# Altium project CC2538 Development Kit Version 2.PrjPcb
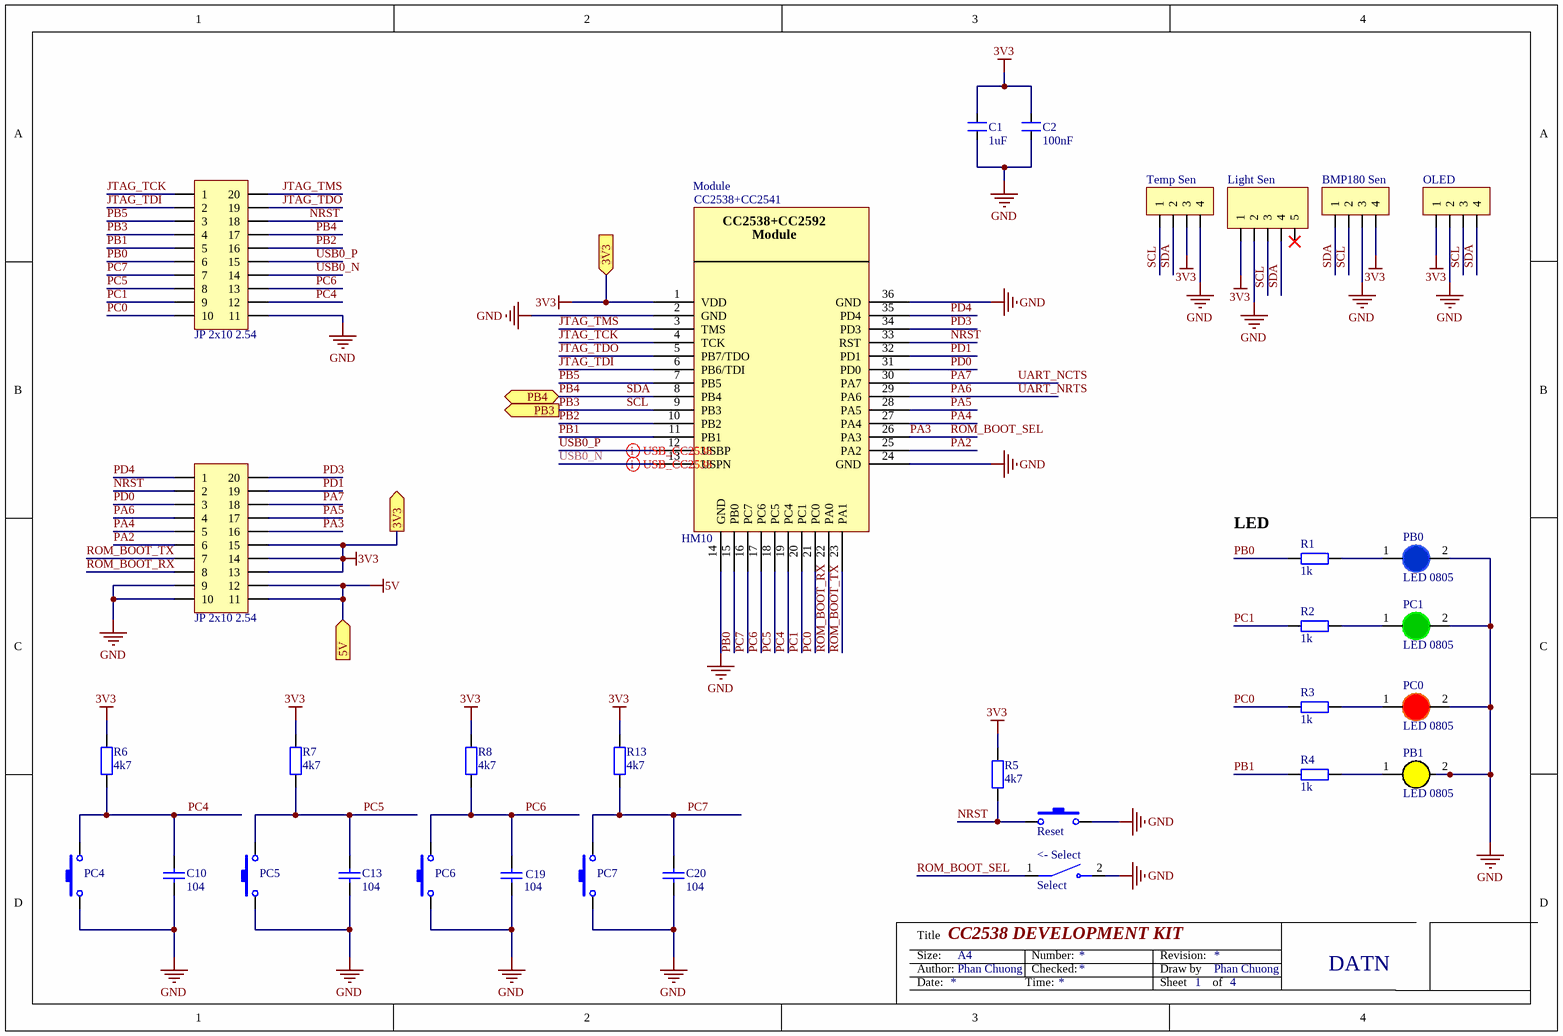
[diagram p0: MCU.SchDoc]
4 sheets, 70 parts. Net scope: global (net labels, ports and power ports of the same name join across sheets).
Board file: PCB.PcbDoc
Sheets:
  MCU.SchDoc
  Power.SchDoc
  Flashing.SchDoc
  RTC.SchDoc

## Sheet MCU.SchDoc: CC2538
size A4; SheetNumber: 1; SheetTotal: 4

### Parts
<-_Select  Select  [SW_KAE01SGGT]
BMP180_Sens  BMP180 Sen  [JP 1x4 CT]
C1  1uF  [SM-0805]
C2  100nF  [SM-0805]
C10  104  [tu 0805]
C13  104  [tu 0805]
C19  104  [tu 0805]
C20  104  [tu 0805]
JP7  JP 2x10 2.54  [JP 2x10 DT]
JP9  JP 2x10 2.54  [JP 2x10 DT]
Light_Sens  Light Sen  [JP 1x5 CT]
Module  HM10  [CC2538+CC2541]
OLED  OLED  [JP 1x4 CT]
PB0  LED 0805  [LED-0805-Blue]
PB1  LED 0805  [LED-0805-Yellow]
PC0  LED 0805  [LED-0805-Red]
PC1  LED 0805  [LED-0805-Green]
PC4  SW-SMD  [SW-SMD]  (value not drawn)
PC5  SW-SMD  [SW-SMD]  (value not drawn)
PC6  SW-SMD  [SW-SMD]  (value not drawn)
PC7  SW-SMD  [SW-SMD]  (value not drawn)
R1  1k  [RES-SMD-0805]
R2  1k  [RES-SMD-0805]
R3  1k  [RES-SMD-0805]
R4  1k  [RES-SMD-0805]
R5  4k7  [tro smd 0805]
R6  4k7  [tro smd 0805]
R7  4k7  [tro smd 0805]
R8  4k7  [tro smd 0805]
R13  4k7  [tro smd 0805]
Reset  SW-SMD  [SW-SMD]  (value not drawn)
Temp_sens  Temp Sen  [JP 1x4 CT]

### Ports
3V3 (in), 3V3 (out), 5V (in), PB3 (out), PB4 (bidir)

### Nets
3V3: BMP180_Sens.4 C1.2 C2.2 JP9.13 JP9.14 JP9.15 Light_Sens.1 Module.1(VDD) OLED.1 R5.2 R6.2 R7.2 R8.2 R13.2 Temp_sens.3 ; port 3V3
5V: JP9.11 JP9.12 ; port 5V
GND: <-_Select.2 BMP180_Sens.3 C1.1 C2.1 C10.2 C13.2 C19.2 C20.2 JP7.11 JP9.9 JP9.10 Light_Sens.2 Module.2(GND) Module.14(GND) Module.24(GND) Module.36(GND) OLED.2 PB0.2(K) PB1.2(K) PC0.2(K) PC1.2(K) PC4.1 PC5.1 PC6.1 PC7.1 Reset.2 Temp_sens.4
JTAG_TCK: JP7.1 Module.4(TCK)
JTAG_TDI: JP7.2 Module.6(PB6/TDI)
JTAG_TDO: JP7.19 Module.5(PB7/TDO)
JTAG_TMS: JP7.20 Module.3(TMS)
NRST: JP7.18 JP9.2 Module.33(RST) R5.1 Reset.1
PA2: JP9.6 Module.25(PA2)
PA3: <-_Select.1 JP9.16 Module.26(PA3)  [also labelled ROM_BOOT_SEL]
PA4: JP9.5 Module.27(PA4)
PA5: JP9.17 Module.28(PA5)
PA6: JP9.4 Module.29(PA6)  [also labelled UART_NRTS]
PA7: JP9.18 Module.30(PA7)  [also labelled UART_NCTS]
PB0: JP7.6 Module.15(PB0) R1.1
PB1: JP7.5 Module.11(PB1) R4.1
PB2: JP7.16 Module.10(PB2)
PB3: BMP180_Sens.2 JP7.4 Light_Sens.3 Module.9(PB3) OLED.3 Temp_sens.1 ; port PB3  [also labelled SCL]
PB4: BMP180_Sens.1 JP7.17 Light_Sens.4 Module.8(PB4) OLED.4 Temp_sens.2 ; port PB4  [also labelled SDA]
PB5: JP7.3 Module.7(PB5)
PC0: JP7.10 Module.21(PC0) R3.1
PC1: JP7.9 Module.20(PC1) R2.1
PC4: C10.1 JP7.12 Module.19(PC4) PC4.2 R6.1
PC5: C13.1 JP7.8 Module.18(PC5) PC5.2 R7.1
PC6: C19.1 JP7.13 Module.17(PC6) PC6.2 R8.1
PC7: C20.1 JP7.7 Module.16(PC7) PC7.2 R13.1
PD0: JP9.3 Module.31(PD0)
PD1: JP9.19 Module.32(PD1)
PD3: JP9.20 Module.34(PD3)
PD4: JP9.1 Module.35(PD4)
ROM_BOOT_RX: JP9.8 Module.22(PA0)
ROM_BOOT_TX: JP9.7 Module.23(PA1)
USB0_N: JP7.14 Module.13(USPN)
USB0_P: JP7.15 Module.12(USBP)
NetPB0_1: PB0.1(A) R1.2
NetPB1_1: PB1.1(A) R4.2
NetPC0_1: PC0.1(A) R3.2
NetPC1_1: PC1.1(A) R2.2

Not connected (* = marked no-connect by the designer): Light_Sens 5*

### Layout directives
differential pair: USB0_N, USB0_P

### Notes on the sheet
- (near R1) LED
- Title
- Size:
- Date:
- Author:
- CC2538 DEVELOPMENT KIT
- A4
- Phan Chuong
- Time:
- Number:
- Checked:
- Revision:
- Sheet
- Draw by
- of
- DATN
- (in symbol CC2538 HM10) CC2538+CC2541; CC2538+CC2592

### Library data of the parts
<-_Select = KAE01SGGT: Dip Switch SPST 1 Position Surface Mount Slide (Standard) Actuator 25mA 24VDC; MF: E-Switch; Check_prices: https://www.snapeda.com/parts/KAE01SGGT/E-Switch/view-part/?ref=eda; Value: *; Availability: In Stock; MP: KAE01SGGT; Price: None; Package: None; SnapEDA_Link: https://www.snapeda.com/parts/KAE01SGGT/E-Switch/view-part/?ref=snap; Purchase-URL: https://pricing.snapeda.com/search/part/KAE01SGGT/?ref=eda
BMP180_Sens OLED Temp_sens = JP 1x4 2.54 Cai Thang: Cắm; Ten_Linh_Kien: Jump Đơn Cái 2.54MM 1x20P Thẳng; Don_Vi: Con; Ma_Hang: MH004006; Ghi_Chu: *; Kieu_Chan: *; Chung_Loai: Cắm
C1 C2 = CM: Cap SMD; Value: 103
C10 C13 C19 C20 = Tu 0805 104 50V 10%: Dán; Don_Vi: Con; So_Chan: 2; Ten_Linh_Kien: Tụ 0805 104-100nF 10% 50V; Ma_Hang: MH004551; Chung_Loai: Dán; Kieu_Chan: *
JP7 JP9 = JP 2x10 2.54 Duc Thang: Cắm; Ten_Linh_Kien: Jump Đôi Đực 2.54MM 2x40P Thẳng 11MM; Don_Vi: Con; Ma_Hang: MH002686; Ghi_Chu: *; Kieu_Chan: *; Chung_Loai: Cắm
Light_Sens = JP 1x5 2.54 Cai Thang: Cắm; Ten_Linh_Kien: Jump Đơn Cái 2.54MM 1x20P Thẳng; Don_Vi: Con; Ma_Hang: MH004006; Ghi_Chu: *; Kieu_Chan: *; Chung_Loai: Cắm
Module = CC2538 HM10: BLE HM10
PB0 = LED 0805 Xanh Duong: Dán; Don_Vi: Con; Ma_Hang: MH002327; Ten_Linh_Kien: LED 0805 Màu Xanh Dương (Blue); Ghi_Chu: *; Kieu_Chan: *; Chung_Loai: Dán
PB1 = LED 0805 Vang: Dán; Don_Vi: Con; Ma_Hang: MH002329; Ten_Linh_Kien: LED 0805 Màu Vàng ( Yellow); Ghi_Chu: *; Kieu_Chan: *; Chung_Loai: Dán
PC0 = LED 0805 Do: Dán; Don_Vi: Con; Ma_Hang: MH000897; Ten_Linh_Kien: LED 0805 Màu Đỏ (Red); Ghi_Chu: *; Kieu_Chan: *; Chung_Loai: Dán
PC1 = LED 0805 Xanh La: Dán; Don_Vi: Con; Ma_Hang: MH002326; Ten_Linh_Kien: LED 0805 Màu Xanh Lá (Green); Ghi_Chu: *; Kieu_Chan: *; Chung_Loai: Dán
PC4-PC7 Reset = SW-SMD: Switch; Published: 24-Mar-1999; LatestRevisionDate: 17-Jul-2002; LatestRevisionNote: Re-released for DXP Platform.; PackageReference: SPST-2; Publisher: Altium Limited
R1-R4 = R: Resistor R1/4W
R5-R8 R13 = Tro 0805 1% 0.22R: Dán; Don_Vi: Con; So_Chan: 2; Ten_Linh_Kien: Trở 0805 1% 0.22R; Ma_Hang: MH005466; Chung_Loai: Dán; Kieu_Chan: *

## Sheet Power.SchDoc
size A4; SheetNumber: 3; SheetTotal: 5
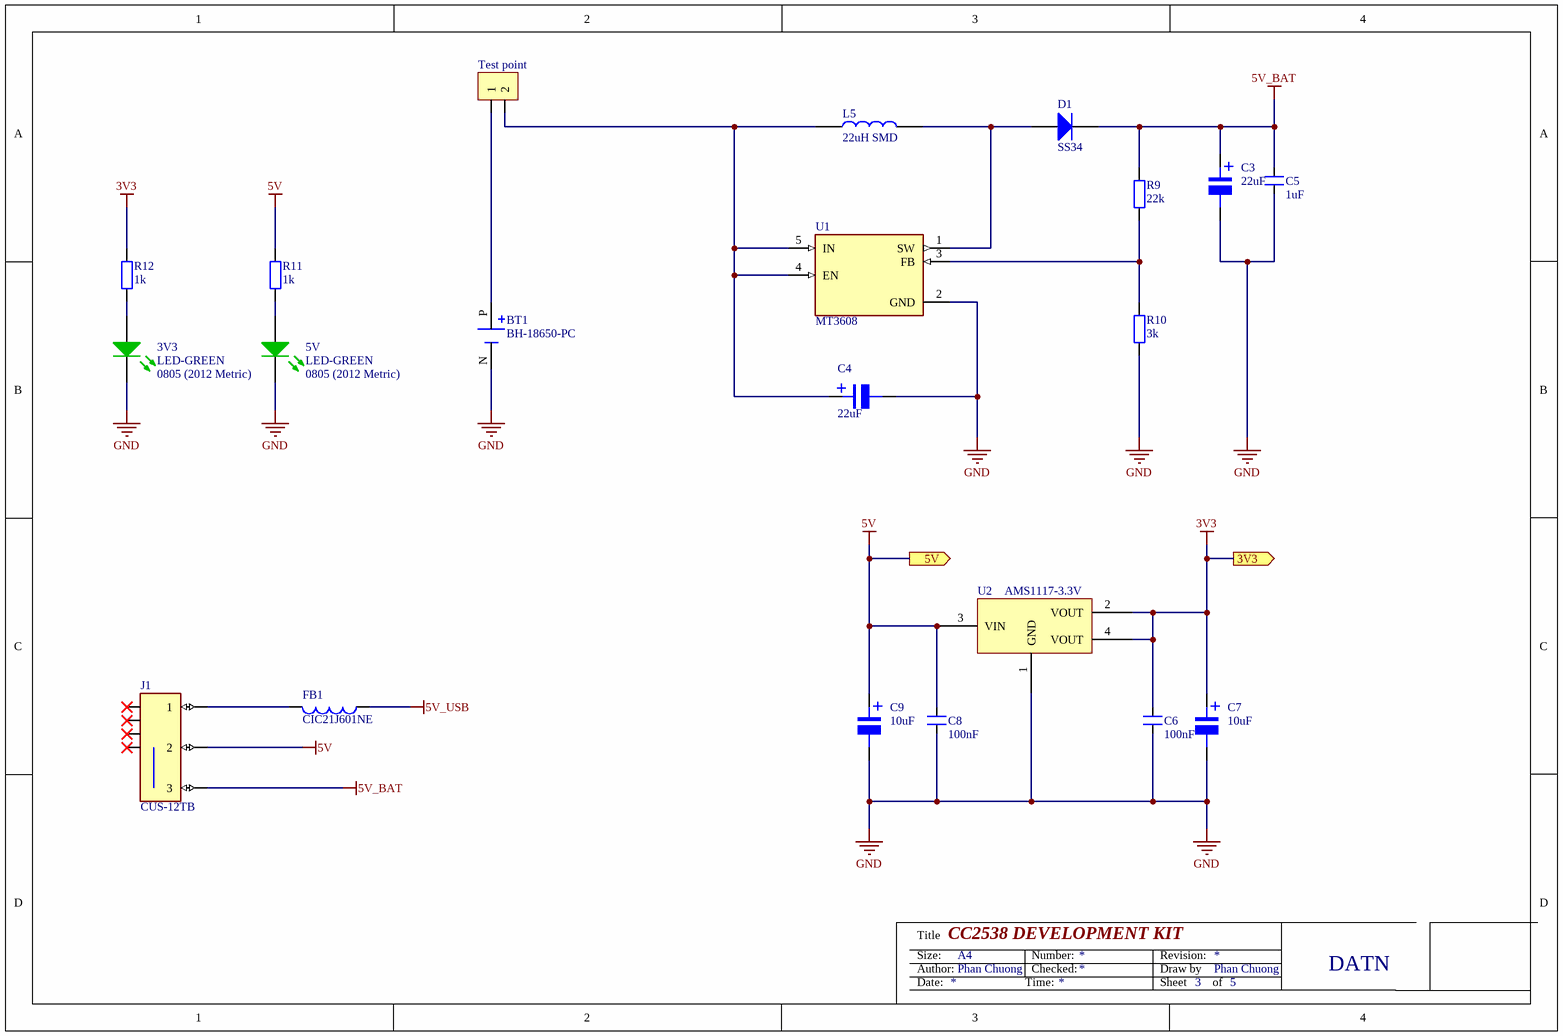
[diagram p1: Power.SchDoc]

### Parts
3V3  LED-GREEN  Package / Case: 0805 (2012 Metric)  [LED_SMD0805_GREEN]
5V  LED-GREEN  Package / Case: 0805 (2012 Metric)  [LED_SMD0805_GREEN]
BT1  BH-18650-PC  [BAT_BH-18650-PC]
C3  22uF  [tu nhom 6.3 (D)]
C4  22uF  [tu nhom 6.3 (D)]
C5  1uF  [SM-0805]
C6  100nF  [SM-0805]
C7  10uF  [tu nhom 6.3 (D)]
C8  100nF  [SM-0805]
C9  10uF  [tu nhom 6.3 (D)]
D1  SS34  [DIODE SMA]
FB1  CIC21J601NE  [INDC0805]
J1  CUS-12TB  [CUS-12B]
JP?  Test point  [JP 1x2 DT]
L5  22uH SMD  [Cuon Cam 7x7x5]
R9  22k  [RES-SMD-0805]
R10  3k  [RES-SMD-0805]
R11  1k  [RES-SMD-0805]
R12  1k  [RES-SMD-0805]
U1  MT3608  [SOT95P280X145-6N]
U2  AMS1117-3.3V  [SOT223]

### Ports
3V3 (out), 5V (out)

### Nets
3V3: C6.2 C7.1 R12.2 U2.2(VOUT) U2.4(VOUT) ; port 3V3
5V: C8.2 C9.1 J1.P$2(2) R11.1 U2.3(VIN) ; port 5V
5V_BAT: C3.1 C5.2 D1.2(K) J1.P$3(3) R9.2
5V_USB: FB1.1
GND: 3V3.2(K) 5V.2(K) BT1.N(NEG) C3.2 C4.2 C5.1 C6.1 C7.2 C8.1 C9.2 R10.1 U1.2(GND) U2.1(GND)
Net3V3_1: 3V3.1(A) R12.1
Net5V_1: 5V.1(A) R11.2
NetBT1_P: BT1.P(POS) JP?.1
NetC4_1: C4.1 JP?.2 L5.1 U1.4(EN) U1.5(IN)
NetD1_1: D1.1(A) L5.2 U1.1(SW)
NetFB1_2: FB1.2 J1.P$1(1)
NetR9_1: R9.1 R10.2 U1.3(FB)

Not connected (* = marked no-connect by the designer): J1 P$4(GND@1)* P$5(GND@2)* P$6(GND@3)* P$7(GND@4)*

### Notes on the sheet
- Title
- Size:
- Date:
- Author:
- CC2538 DEVELOPMENT KIT
- A4
- Phan Chuong
- Time:
- Number:
- Checked:
- Revision:
- Sheet
- Draw by
- of
- DATN
- (in symbol Tu Nhom 22uF 25V) +

### Library data of the parts
3V3 5V = LED_LTST-C171KGKT: LED GREEN CLEAR 0805 SMD; Manufacturer: Lite-On Inc.; Lens Color: Colorless; Millicandela Rating: 35mcd; Lens Style/Size: Rectangle with Flat Top, 1.40mm x 1.25mm; Voltage - Forward (Vf) (Typ): 2V; Current - Test: 20mA; Viewing Angle: 130°; Wavelength - Dominant: 571nm; Wavelength - Peak: 574nm; Supplier 1: Digi-Key; Manufacturer Part Number: LTST-C171KGKT; RoHS: RoHS Compliant; Category: Optoelectronics; Stock 1: 329702; Pricing 1: 1=0.35, 10=0.255, 25=0.188, 100=0.1344, 250=0.09136, 500=0.08062, 1000=0.06314 (USD); Packaging: Cut Tape (CT); Part Status: Active; Color: Green; Lens Transparency: Clear; Mounting Type: Surface Mount; Features: -; Size / Dimension: 2.00mm L x 1.25mm W; Height (Max): 0.90mm; ComponentLink1URL: http://optoelectronics.liteon.com/upload/download/DS22-2000-118/LTST-C171KGKT.pdf; ComponentLink1Description: http://optoelectronics.liteon.com/upload/download/DS22-2000-118/LTST-C171KGKT.pdf; Supplier Part Number 1: 160-1426-1-ND
BT1 = BH-18650-PC: Battery Holder (Open) 18650 1 Cell PC Pin; MF: Memory Protection Devices; SnapEDA_Link: https://www.snapeda.com/parts/BH-18650-PC/Memory+Protection+Devices/view-part/?ref=snap; Package: None; Value: *; MP: BH-18650-PC; Check_prices: https://www.snapeda.com/parts/BH-18650-PC/Memory+Protection+Devices/view-part/?ref=eda
C3 C4 C7 C9 = Tu Nhom 22uF 25V: Dán; Don_Vi: Con; So_Chan: 2; Ten_Linh_Kien: Tụ Nhôm 22uF 25V; Ma_Hang: MH007613; Chung_Loai: Dán; Kieu_Chan: *
C5 C6 C8 = CM: Cap SMD; Value: 103
D1 = Diode SS34 ( 1N5822 ): Dán; Don_Vi: Con; Ma_Hang: MH002104; Ten_Linh_Kien: Diode SS34 3A 40V SMA ( 1N5822 SS34A); Kieu_Chan: *; Chung_Loai: Dán
FB1 = FERRITE BEAD_CIC21J601NE: FERRITE BEAD 600 OHM 0805 1LN; Manufacturer: Samsung Electro-Mechanics; Filter Type: Power Line; Current Rating (Max): 1A; DC Resistance (DCR) (Max): 100 mOhm; Supplier 1: Digi-Key; Manufacturer Part Number: CIC21J601NE; RoHS: RoHS Compliant; Category: Filters; Stock 1: 98190; Pricing 1: 1=0.1, 10=0.066, 25=0.06, 50=0.054, 100=0.0396, 250=0.0288, 500=0.0264, 1000=0.0228 (USD); Packaging: Cut Tape (CT); Part Status: Active; Ratings: -; Operating Temperature: -55°C ~ 125°C; Package / Case: 0805 (2012 Metric); Mounting Type: Surface Mount; Height (Max): 0.043" (1.10mm); Size / Dimension: 0.079" L x 0.049" W (2.00mm x 1.25mm); ComponentLink1URL: http://www.samsungsem.com/kr/support/product-search/bead/CIC21J601NE.jsp; ComponentLink1Description: http://www.samsungsem.com/kr/support/product-search/bead/CIC21J601NE.jsp; Supplier Part Number 1: 1276-6371-1-ND
J1 = CUS-12TB: Slide Switch SPDT Surface Mount, Right Angle; MF: Nidec Copal; SnapEDA_Link: https://www.snapeda.com/parts/CUS-12TB/Nidec/view-part/?ref=snap; Package: None; Value: *; MP: CUS-12TB; Check_prices: https://www.snapeda.com/parts/CUS-12TB/Nidec/view-part/?ref=eda
JP? = JP 1x2 2.54 Duc Thang: Cắm; Ten_Linh_Kien: Jump Đơn Đực 2.54MM 1x40P Thẳng 11MM; Don_Vi: Con; Ma_Hang: MH000903; Ghi_Chu: *; Kieu_Chan: *; Chung_Loai: Cắm
L5 = CUON CAM 47uH SMD: Dán; Don_Vi: Con; Ma_Hang: MH004211; Ten_Linh_Kien: Cuộn Cảm 47uH 7x7x4MM CD74R; Ghi_Chu: *; Kieu_Chan: *; Chung_Loai: Dán
R9-R12 = R: Resistor R1/4W
U1 = MT3608: High Efficiency 1.2MHz2A Step Up Converter; MF: Aerosemi Technology Co., Ltd; Price: None; Availability: Not in stock; Package: Package; MP: MT3608; Value: *; SnapEDA_Link: https://www.snapeda.com/parts/MT3608/Aerosemi+Technology+Co.%252C+Ltd/view-part/?ref=snap; Check_prices: https://www.snapeda.com/parts/MT3608/Aerosemi+Technology+Co.%252C+Ltd/view-part/?ref=eda
U2 = AMS1117 SMD: Dán; Value: AMS1117-3.3V SOT223; Don_Vi: Con; Ma_Hang: MH000596; Ghi_Chu: *; Kieu_Chan: *; Chung_Loai: Dán

## Sheet Flashing.SchDoc
size A4; SheetNumber: 3; SheetTotal: 4
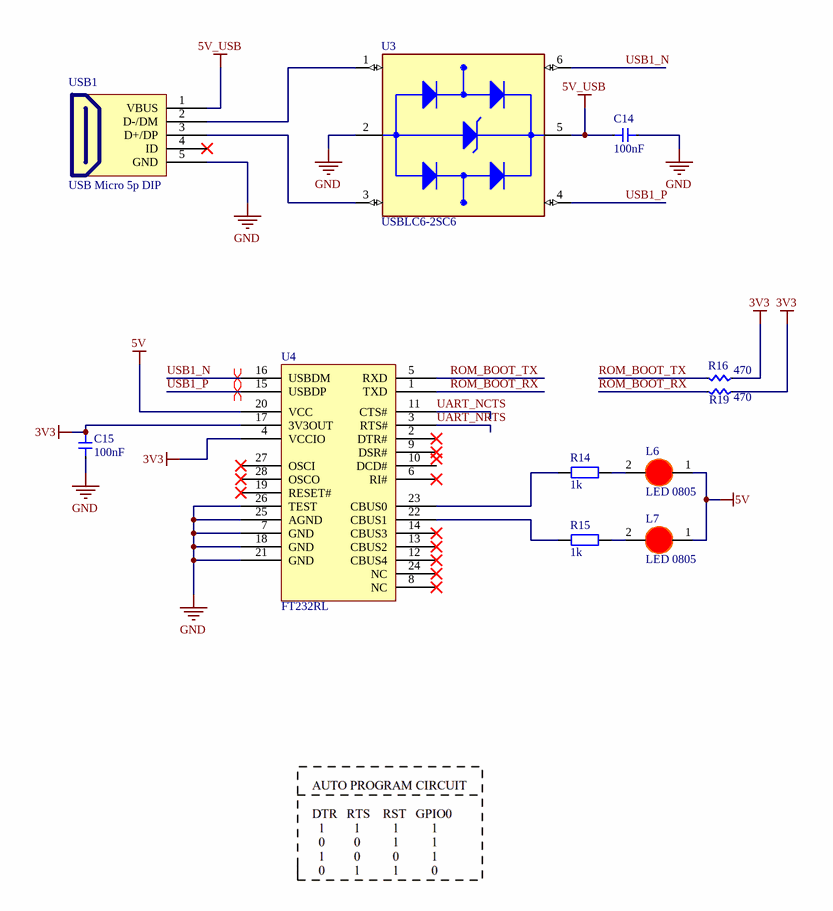
[diagram p2: Flashing.SchDoc]

### Parts
C14  100nF  [Cap 0805]
C15  100nF  [Cap 0805]
L6  LED 0805  [LED-0805-Red]
L7  LED 0805  [LED-0805-Red]
R14  1k  [RES-SMD-0805]
R15  1k  [RES-SMD-0805]
R16  470  [RES 0805]
R19  470  [RES 0805]
U3  USBLC6-2SC6  [SOT95P280X145-6N]
U4  FT232RL  [TSSOP28_25.5_295_15X58_SMD]
USB1  USB Micro 5p DIP  [USB Micro 5p DIP]

### Nets
3V3: C15.2 R16.1 R19.1 U4.4(VCCIO) U4.17(3V3OUT)
5V: L6.1(A) L7.1(A) U4.20(VCC)
5V_USB: C14.1 U3.5(VBUS) USB1.1(VBUS)
GND: C14.2 C15.1 U3.2(GND) U4.7(GND) U4.18(GND) U4.21(GND) U4.25(AGND) U4.26(TEST) USB1.5(GND)
ROM_BOOT_RX: R19.2 U4.1(TXD)
ROM_BOOT_TX: R16.2 U4.5(RXD)
UART_NCTS: U4.11(CTS#)  [project net PA7]
UART_NRTS: U4.3(RTS#)  [project net PA6]
USB1_N: U3.6(I/O1_OUT) U4.16(USBDM)
USB1_P: U3.4(I/O2_OUT) U4.15(USBDP)
NetL6_2: L6.2(K) R14.2
NetL7_2: L7.2(K) R15.2
NetR14_1: R14.1 U4.23(CBUS0)
NetR15_1: R15.1 U4.22(CBUS1)
NetU3_1: U3.1(I/O1_IN) USB1.2(D-/DM)
NetU3_3: U3.3(I/O2_IN) USB1.3(D+/DP)

Not connected (* = marked no-connect by the designer): U4 2(DTR#)* 6(RI#)* 8(NC)* 9(DSR#)* 10(DCD#) 12(CBUS4)* 13(CBUS2)* 14(CBUS3)* 19(RESET#)* 24(NC)* 27(OSCI)* 28(OSCO)*; USB1 4(ID)*

### Layout directives
differential pair: USB1_N, USB1_P

### Notes on the sheet
- Title
- Size:
- Date:
- Author:
- CC2538 DEVELOPMENT KIT
- A4
- Phan Chuong
- Time:
- Number:
- Checked:
- Revision:
- Sheet
- Draw by
- of
- DATN

### Library data of the parts
C14 C15 = Cap 0805: Capacitor SMD 0805
L6 L7 = LED 0805 Do: as PC0 on sheet MCU; Ghi_Chu: *; Kieu_Chan: *; Chung_Loai: Dán
R14 R15 = R: Resistor R1/4W
R16 R19 = RES 0805: RES SMD 0805; Manufacturer: Vishay Dale; Manufacturer Part Number: CRCW040210K0FKED; Resistance (Ohms): 10k; Tolerance: ±1%; Power (Watts): 0.063W, 1/16W; Temperature Coefficient: ±100ppm/°C; Supplier 1: Digi-Key; RoHS: RoHS Compliant; Category: Resistors; Stock 1: 2392462; Pricing 1: 10=0.083, 50=0.0444, 200=0.0255, 1000=0.0174 (USD); Packaging: Cut Tape (CT); Composition: Thick Film; Features: Automotive AEC-Q200; Operating Temperature: -55°C ~ 155°C; Package / Case: 0402 (1005 Metric); Supplier Device Package: 0402 (1005 Metric); Size / Dimension: 0.039" L x 0.020" W (1.00mm x 0.50mm); Height: 0.016" (0.40mm); Number of Terminations: 2; ComponentLink1URL: http://www.vishay.com/docs/20035/dcrcwe3.pdf; ComponentLink1Description: http://www.vishay.com/docs/20035/dcrcwe3.pdf; Supplier Part Number 1: 541-10.0KLCT-ND
U3 = USBLC6-2SC6: 17V Clamp 5A (8/20Âµs) Ipp Tvs Diode Surface Mount SOT-23-6; MF: STMicroelectronics; Value: *; SnapEDA_Link: https://www.snapeda.com/parts/USBLC6-2SC6/STMicroelectronics/view-part/?ref=snap; Check_prices: https://www.snapeda.com/parts/USBLC6-2SC6/STMicroelectronics/view-part/?ref=eda; Purchase-URL: https://pricing.snapeda.com/search/part/USBLC6-2SC6/?ref=eda; Price: None; Availability: In Stock; Package: SOT-23-6 STMicroelectronics; MP: USBLC6-2SC6
U4 = IC_FT232RL: USB Bridge, USB to UART USB 2.0 UART Interface 28-SSOP; Manufacturer: FTDI; Alternate Part Number-1: NA; Manufacturer Part Number: FT232RL; Case/Package: TSSOP28; Supplier-1: Aliepress; Supplier Part Number-1: FT232RL
USB1 = USB Micro 5p DIP: USB Type B; Ten: MicroUSB MK5P DIP; Ma_Hang: MH005145

## Sheet RTC.SchDoc
size A4; SheetNumber: 5; SheetTotal: 5
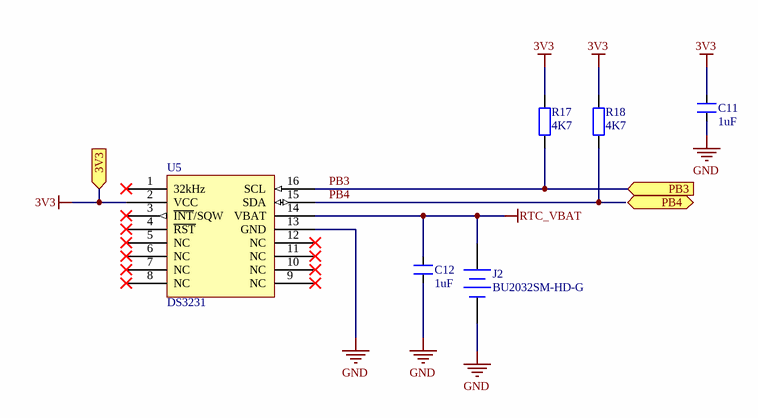
[diagram p3: RTC.SchDoc]

### Parts
C11  1uF  [SM-0805]
C12  1uF  [SM-0805]
J2  BU2032SM-HD-G  [BATTERY HOLDER_BU2032SM-HD-G]
R17  4K7  [RES-SMD-0805]
R18  4K7  [RES-SMD-0805]
U5  DS3231  [SL3016]

### Ports
3V3 (in), PB3 (in), PB4 (bidir)

### Nets
3V3: C11.2 R17.2 R18.2 U5.2(VCC) ; port 3V3
GND: C11.1 C12.1 J2.2(-) U5.13(GND)
RTC_VBAT: C12.2 J2.1(+) U5.14(VBAT)
PB3: R17.1 U5.16(SCL) ; port PB3
PB4: R18.1 U5.15(SDA) ; port PB4

Not connected (* = marked no-connect by the designer): U5 1(32kHz)* 3(~{INT}/SQW)* 4(~{RST})* 5(NC)* 6(NC)* 7(NC)* 8(NC)* 9(NC)* 10(NC)* 11(NC)* 12(NC)*

### Notes on the sheet
- Title
- Size:
- Date:
- Author:
- CC2538 DEVELOPMENT KIT
- A4
- Phan Chuong
- Time:
- Number:
- Checked:
- Revision:
- Sheet
- Draw by
- of
- DATN

### Library data of the parts
C11 C12 = CM: Cap SMD; Value: 103
J2 = BATTERY HOLDER_BU2032SM-HD-G: HOLDER COIN CELL 2032 SMD; Manufacturer: MPD (Memory Protection Devices); Battery Type, Function: Coin Cell, Holder; Style: Holder (Open); Battery Cell Size: Coin, 20.0mm; Number of Cells: 1; Battery Series: 2032; Supplier 1: Digi-Key; Manufacturer Part Number: BU2032SM-HD-G; RoHS: RoHS Compliant; Category: Battery Products; Stock 1: 72564; Pricing 1: 1=0.89, 10=0.828 (USD); Part Status: Active; Mounting Type: PCB, Surface Mount; Termination Style: SMD (SMT) Tab; Height Above Board: 0.208" (5.28mm); Operating Temperature: -40°C ~ 280°C; ComponentLink1URL: http://www.memoryprotectiondevices.com/datasheets/BU2032SM-HD-G-datasheet.pdf; ComponentLink1Description: http://www.memoryprotectiondevices.com/datasheets/BU2032SM-HD-G-datasheet.pdf; Supplier Part Number 1: BU2032SM-HD-GDKR-ND
R17 R18 = R: Resistor R1/4W

## Nets that join several sheets
3V3: MCU (15 pins), Power (5 pins), Flashing (5 pins), RTC (C11.2 R17.2 R18.2 U5.2)
5V: MCU (JP9.11 JP9.12), Power (5 pins), Flashing (L6.1 L7.1 U4.20)
5V_USB: Power (FB1.1), Flashing (C14.1 U3.5 USB1.1)
GND: MCU (27 pins), Power (13 pins), Flashing (9 pins), RTC (C11.1 C12.1 J2.2 U5.13)
PA6: MCU (JP9.4 Module.29), Flashing (U4.3)
PA7: MCU (JP9.18 Module.30), Flashing (U4.11)
PB3: MCU (6 pins), RTC (R17.1 U5.16)
PB4: MCU (6 pins), RTC (R18.1 U5.15)
ROM_BOOT_RX: MCU (JP9.8 Module.22), Flashing (R19.2 U4.1)
ROM_BOOT_TX: MCU (JP9.7 Module.23), Flashing (R16.2 U4.5)